# EasyEDA Pro project MovingTarget_MotorConT1_2026-10-31.epro

# Schematic Schematic1
Board Name: MotorConT1; Create Date: 2026-02-08; Page Name: P1; Project Name: MovingTarget; Schematic Name: Schematic1; Update Date: 2026-03-16; Company: EasyEDA.com; Page Size: A4; Version: V1.0
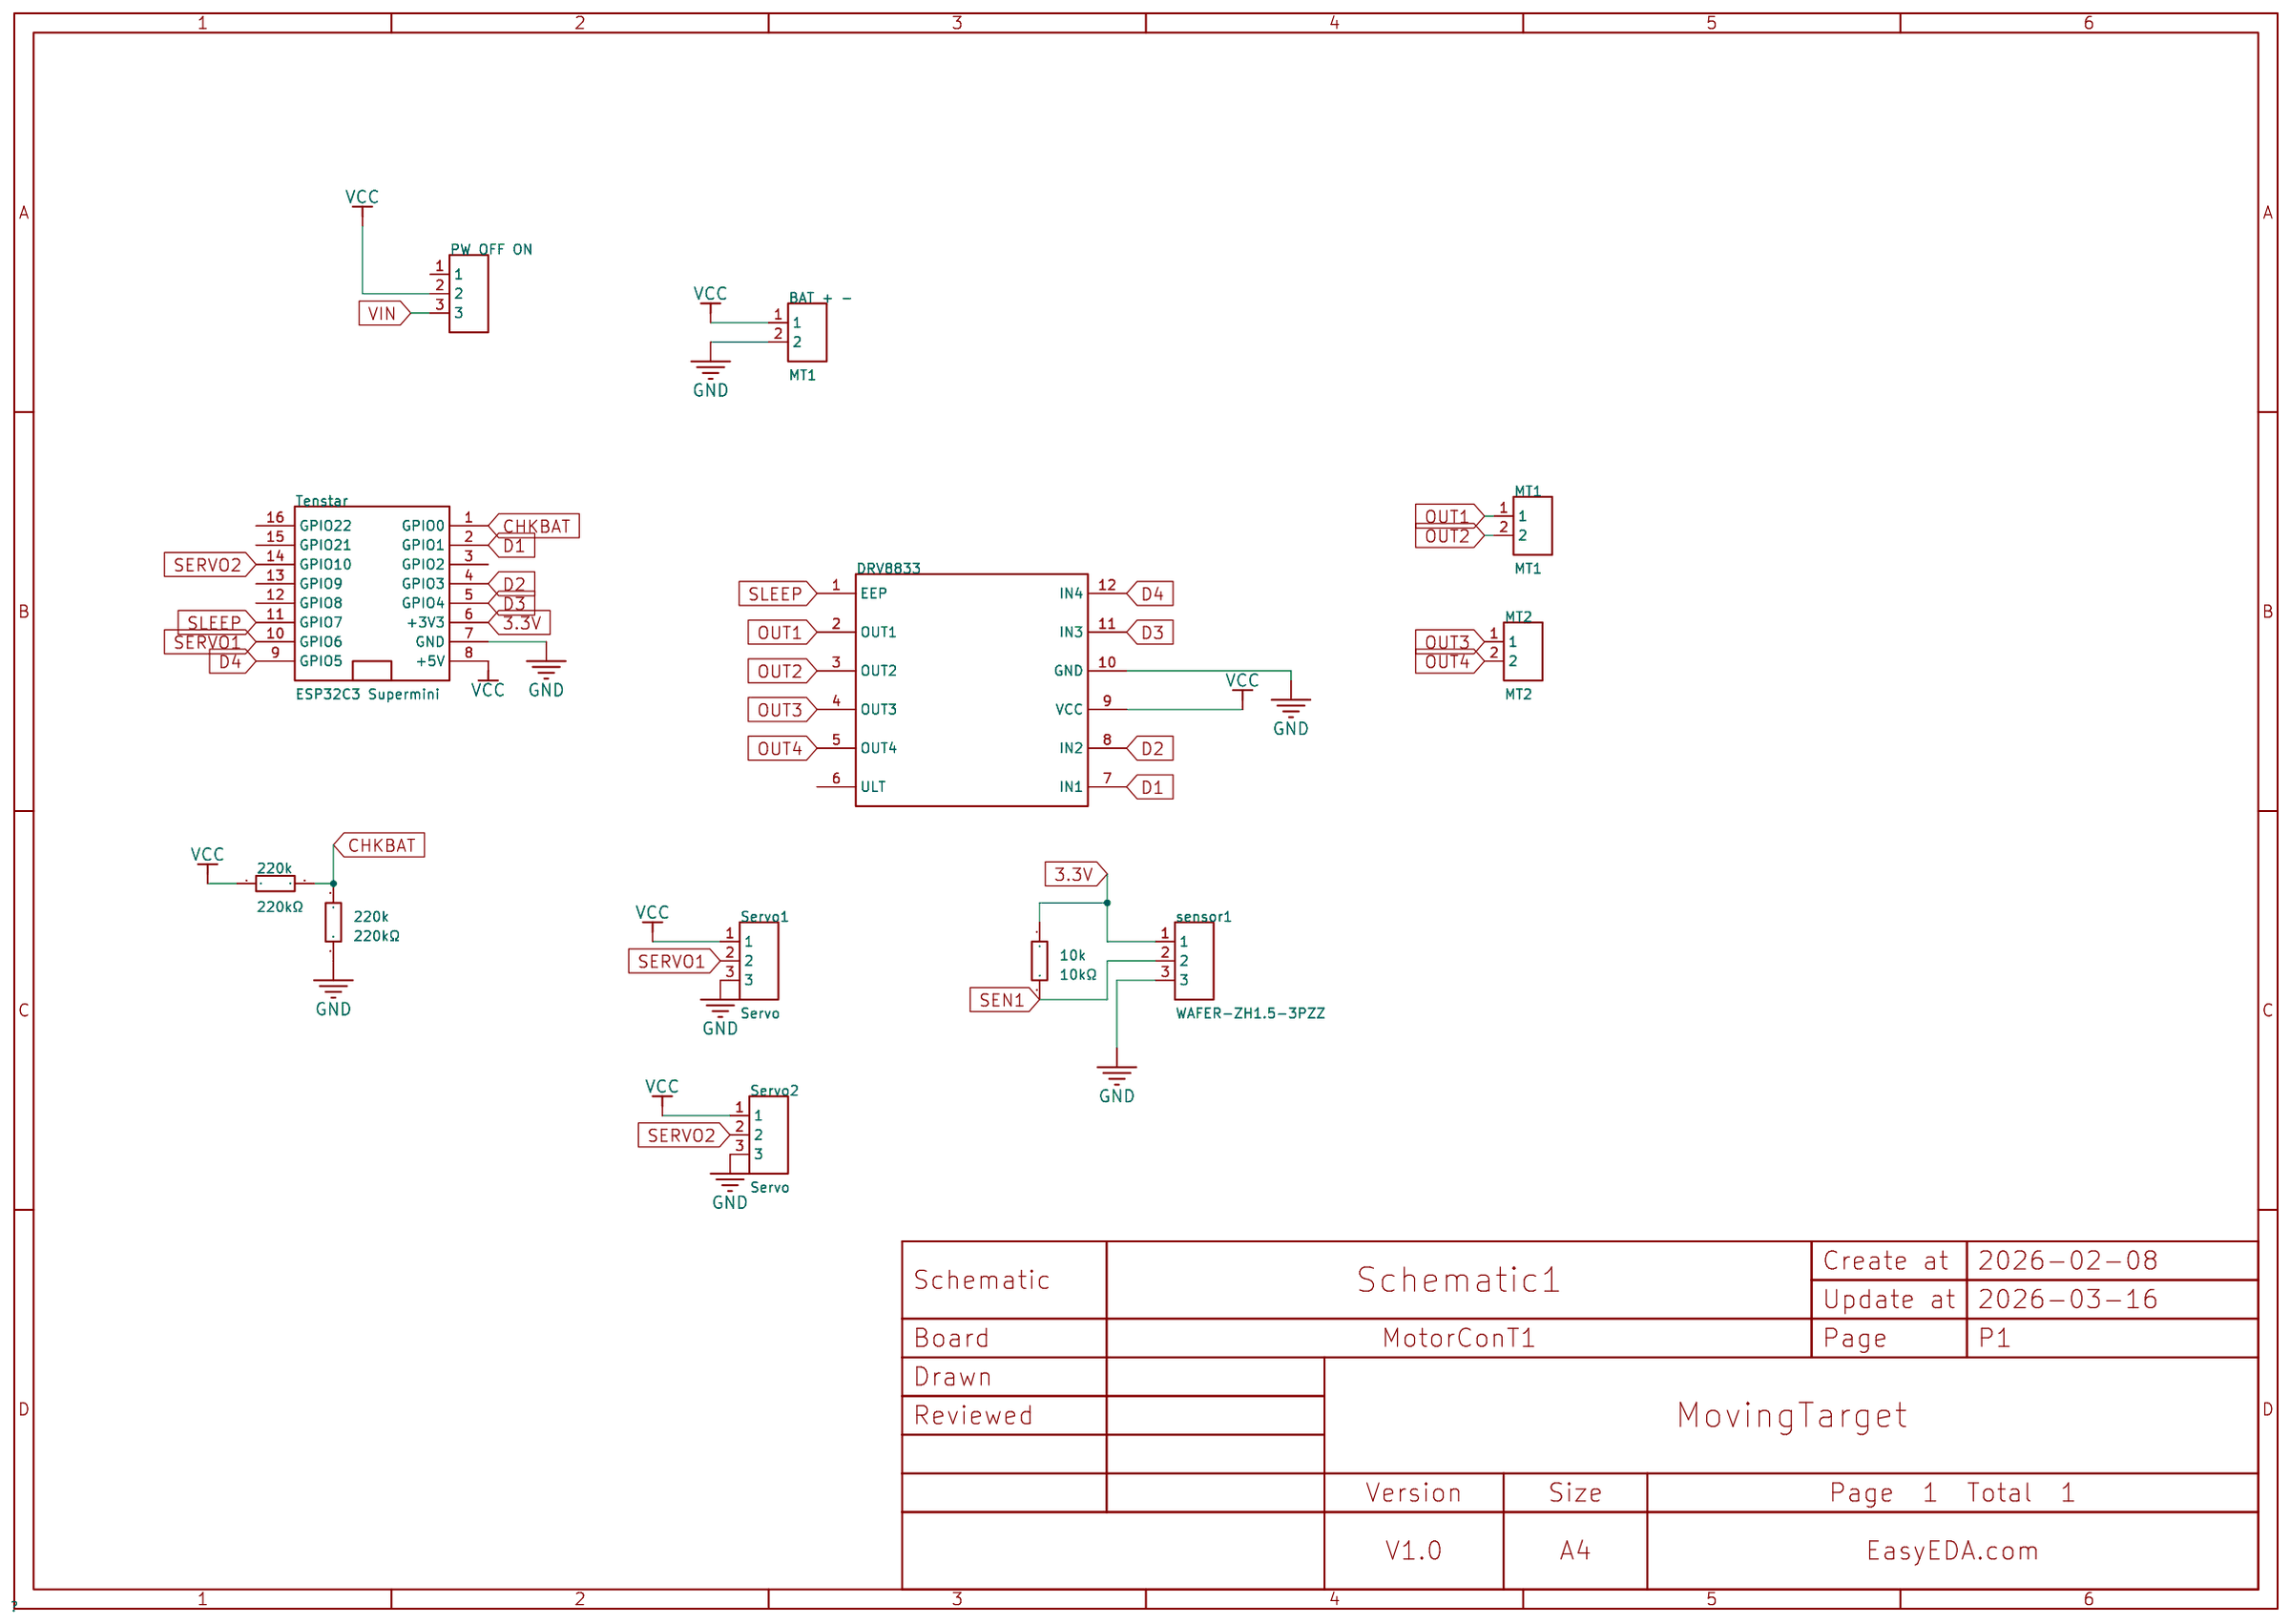
[diagram p0: schematic sheet]

## Parts
10k  10kΩ  [R_AXIAL-0.4]
220k  220kΩ  [R_AXIAL-0.4]
220k#2  220kΩ  [R_AXIAL-0.4]
BAT + -  MT1  [CONN-TH_2P-P1.50_HCTL_HC-ZH1.5-2AW]
DRV8833  -  [DRV8833]
MT1  MT1  [CONN-TH_2P-P1.50_HCTL_HC-ZH1.5-2AW]
MT2  MT2  [CONN-TH_2P-P1.50_HCTL_HC-ZH1.5-2AW]
PW OFF ON  -  [HDR-TH_3P-P2.54-V-M]
sensor1  WAFER-ZH1.5-3PZZ  [CONN-TH_3P-P1.50_A1500WV-03P]
Servo1  Servo  [HDR-TH_3P-P2.54-V-M]
Servo2  Servo  [HDR-TH_3P-P2.54-V-M]
Tenstar  ESP32C3 Supermini  [ESP32C3 SM]

## Library data of the parts
10k 220k 220k#2 = Res_AXIAL-1/4W: Supplier Footprint: Through
BAT + - MT1 MT2 = BX-ZH1.5-2PWZ: 插针结构:1x2P;间距:1.5mm;安装方式:弯插;参考系列:ZH;总PIN数:2P;排数:1;每排PIN数:2;行距:-;额定电流:-;触头材质:黄铜;触头镀层:锡;工作温度:-25℃~+85℃;; LCSC Part Name: 1x2P 间距:1.5mm 弯插 系列:ZH; Supplier Part: C18077736; Manufacturer: Bossie(博锡); Supplier Footprint: 弯插,P=1.5mm; JLCPCB Part Class: 扩展库; Datasheet: https://atta.szlcsc.com/upload/public/pdf/source/20231017/D4B8CDB16C0CF009D30ACC8356399B5A.pdf; Supplier: LCSC; Pins Structure: 1x2P; Pitch: 1.5mm; Mounting Type: 弯插; Reference Series: ZH; Number of Pins: 2P; Number of Rows: 1; Number of PINs Per Row: 2; Contact Material: 黄铜; Contact Plating: 锡; Operating Temperature: -25℃~+85℃; Voltage Rating: 250V; Plastic Material: PA66; Flame Retardant Rating: UL94V-0; Color: 白色; Z-Height of the Board: 3.7mm; X-Length of Bottom Edge on Board (Spacing Line): 4.5mm; Y-Width of Bottom Edge on Board: 4.55mm
DRV8833 = DRV8833: _: 3
PW OFF ON Servo1 Servo2 = HDR-M_2.54_1x3P: Supplier Footprint: Through
sensor1 = WAFER-ZH1.5-3PZZ: Pins Structure:1x3P Pitch:1.5mm Mounting Type:Through Hole Reference Series:ZH Number of Pins:3P Number of Rows:1 Number of PINs Per Row:3 Row Spacing:- Current Rating:2A Contact Material:Brass Contact Plating:Tin Operating Temperature:-25℃~+85℃ Operating; LCSC Part Name: 1x3P 间距:1.5mm 直插 系列:ZH; Supplier Part: C5359584; Manufacturer: XUNPU(讯普); Supplier Footprint: 插件,P=1.5mm; JLCPCB Part Class: Extended Part; Datasheet: https://item.szlcsc.com/datasheet/WAFER-ZH1.5-3PZZ/6173820.html; Supplier: LCSC; Pins Structure: 1x3P; Pitch: 1.5mm; Mounting Type: Through Hole; Reference Series: ZH; Number of Pins: 3P; Number of Rows: 1; Number of PINs Per Row: 3; Current Rating: 2A; Contact Material: Brass; Contact Plating: Tin; Operating Temperature: -25℃~+85℃; Voltage Rating: 250V; Plastic Material: PA66; Flame Retardant Rating: UL94V-0; Color: Beige; Z-Height of the Board: 4.55mm; X-Length of Bottom Edge on Board (Spacing Line): 6mm; Y-Width of Bottom Edge on Board: 3.7mm
Tenstar = ESP32C3 Supermini

## Nets
3.3V: 10k.1 sensor1.1 Tenstar.6(+3V3)
GND: 220k#2.1 BAT + -.2 DRV8833.10(GND) sensor1.3 Servo1.3 Servo2.3 Tenstar.7(GND)
VCC: 220k.1 BAT + -.1 DRV8833.9(VCC) PW OFF ON.2 Servo1.1 Servo2.1 Tenstar.8(+5V)
VIN: PW OFF ON.3
CHKBAT: 220k.2 220k#2.2 Tenstar.1(GPIO0)
D1: DRV8833.7(IN1) Tenstar.2(GPIO1)
D2: DRV8833.8(IN2) Tenstar.4(GPIO3)
D3: DRV8833.11(IN3) Tenstar.5(GPIO4)
D4: DRV8833.12(IN4) Tenstar.9(GPIO5)
OUT1: DRV8833.2(OUT1) MT1.1
OUT2: DRV8833.3(OUT2) MT1.2
OUT3: DRV8833.4(OUT3) MT2.1
OUT4: DRV8833.5(OUT4) MT2.2
SEN1: 10k.2 sensor1.2
SERVO1: Servo1.2 Tenstar.10(GPIO6)
SERVO2: Servo2.2 Tenstar.14(GPIO10)
SLEEP: DRV8833.1(EEP) Tenstar.11(GPIO7)

Not connected (* = marked no-connect by the designer): DRV8833 6(ULT); PW OFF ON 1; Tenstar 3(GPIO2) 12(GPIO8) 13(GPIO9) 15(GPIO21) 16(GPIO22)

# Board PCB1
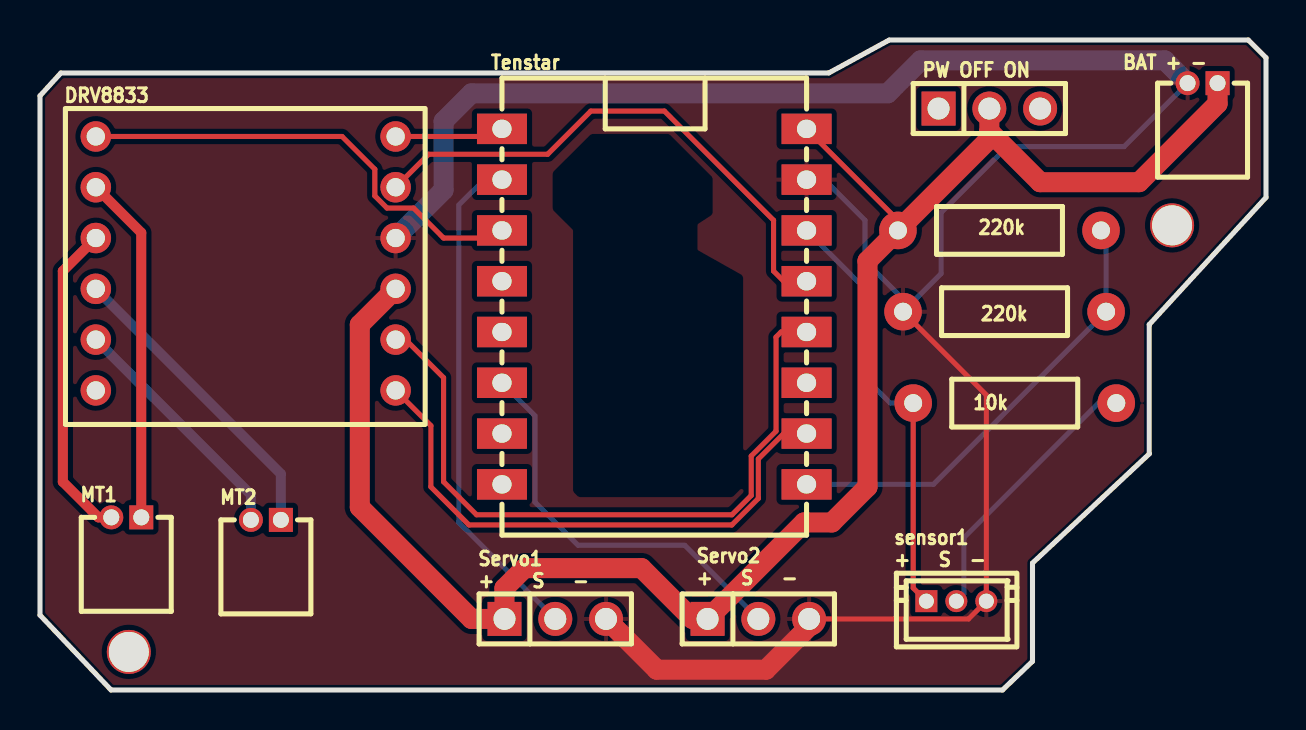
[diagram p1: board, top side]
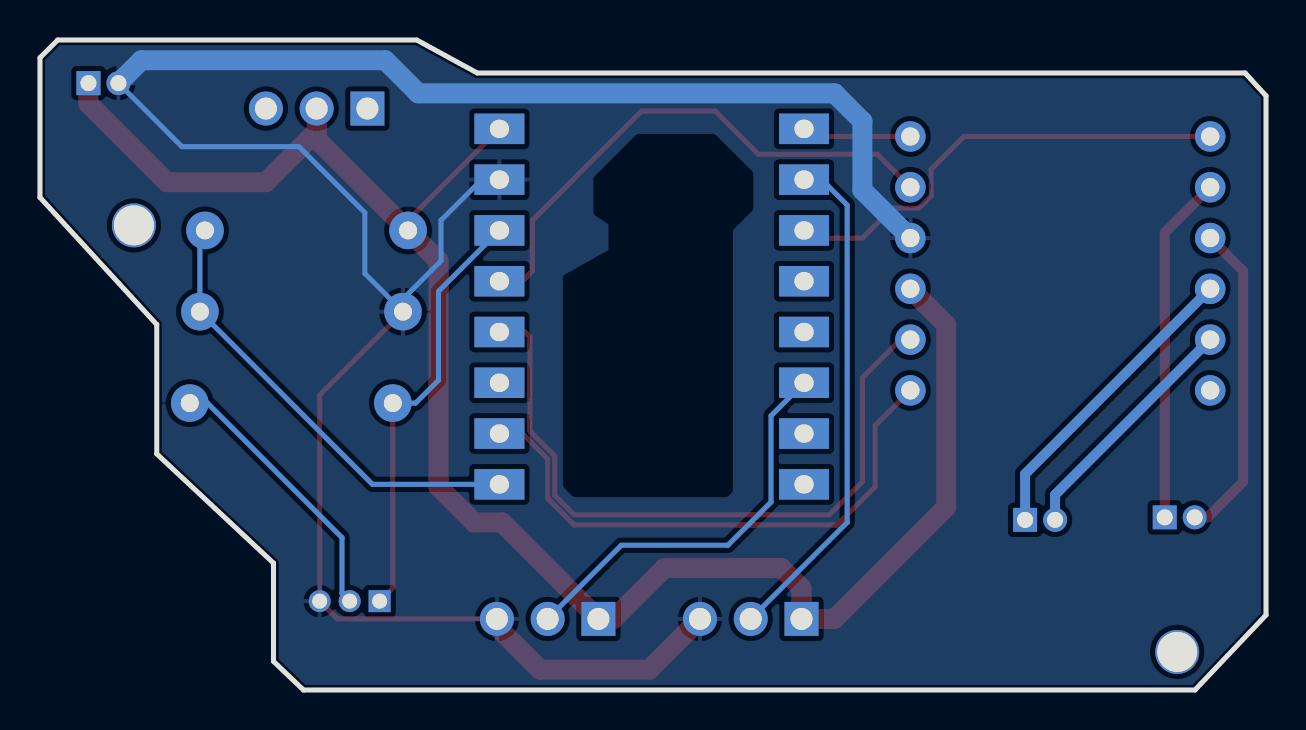
[diagram p2: board, bottom side, seen from below]

Outline 61.34 x 32.51 mm; copper layers: Top Layer, Bottom Layer. Coordinates in mm from the lower left corner of the outline.
Outline path: 0,29.72 1.05,30.86 39.46,30.86 42.49,32.51 60.45,32.51 61.34,31.62 61.34,24.64 55.5,18.28 55.5,11.81 49.66,6.35 49.66,1.43 48.16,0 3.56,0 0,3.75 0,29.72
Stack: Top Layer 0.035mm / Dielectric1 1.51mm FR4 er 4.5 / Bottom Layer 0.035mm

## Design rules (mm)
spacing copperThickness1oz (default): track to track 0.102, other pairs 0.152 to 0.3
spacing copperThickness2oz: track to track 0.203, other pairs 0.152 to 0.3
spacing Plane_innerPlane: track to track 0.102, other pairs 0.152 to 0.3
spacing Copper_copperRegion: track to track 0.102, other pairs 0.152 to 0.3
track width copperThickness1oz (default): min 0.127, default 0.254, max 2.54
track width copperThickness2oz: min 0.203, default 0.254, max 2.54
differential pair differentialPair (default): width min 0.127, default 0.254, max 2.54; gap min 0.152, default 0.152
net CHKBAT uses Copper_copperRegion, Plane_innerPlane
net D1 uses Copper_copperRegion, Plane_innerPlane
net D2 uses Copper_copperRegion, Plane_innerPlane
net D3 uses Copper_copperRegion, Plane_innerPlane
net 3.3V uses Copper_copperRegion, Plane_innerPlane
net GND uses Copper_copperRegion, Plane_innerPlane
net VCC uses Copper_copperRegion, Plane_innerPlane
net D4 uses Copper_copperRegion, Plane_innerPlane
net SERVO1 uses Copper_copperRegion, Plane_innerPlane
net SLEEP uses Copper_copperRegion, Plane_innerPlane
net SERVO2 uses Copper_copperRegion, Plane_innerPlane
net OUT1 uses Copper_copperRegion, Plane_innerPlane
net OUT2 uses Copper_copperRegion, Plane_innerPlane
net OUT3 uses Copper_copperRegion, Plane_innerPlane
net OUT4 uses Copper_copperRegion, Plane_innerPlane
net VIN uses Copper_copperRegion, Plane_innerPlane
net SEN1 uses Copper_copperRegion, Plane_innerPlane
pour e121 uses Copper_copperRegion
pour e148 uses Copper_copperRegion

## Placement (name value [footprint] x y rotation side)
10k  10kΩ  [R_AXIAL-0.4]  48.77 14.35 0 top
220k  220kΩ  [R_AXIAL-0.4]  48.01 22.99 0 top
220k#2  220kΩ  [R_AXIAL-0.4]  48.26 18.92 0 top
BAT + -  MT1  [CONN-TH_2P-P1.50_HCTL_HC-ZH1.5-2AW]  58.17 30.35 0 top
DRV8833  -  [DRV8833]  1.27 29.21 0 top
MT1  MT1  [CONN-TH_2P-P1.50_HCTL_HC-ZH1.5-2AW]  4.32 8.64 0 top
MT2  MT2  [CONN-TH_2P-P1.50_HCTL_HC-ZH1.5-2AW]  11.3 8.51 0 top
NOREF  -  [Pad_e1]  56.64 23.24 0 top
NOREF#2  -  [Pad_e2]  4.45 1.91 0 top
PW OFF ON  -  [HDR-TH_3P-P2.54-V-M]  47.5 29.08 0 top
sensor1
+   S  -  -  [CONN-TH_3P-P1.50_A1500WV-03P]  45.85 4.44 0 top
Servo1
+    S   -  -  [HDR-TH_3P-P2.54-V-M]  25.78 3.56 0 top
Servo2
+   S   -  -  [HDR-TH_3P-P2.54-V-M]  35.94 3.56 0 top
Tenstar  ESP32C3 Supermini  [ESP32C3 SM]  30.73 19.18 0 top

## Footprints (pads in the part's own frame, mm; a bottom-side part is the same pattern mirrored in y, then rotated)
CONN-TH_2P-P1.50_HCTL_HC-ZH1.5-2AW
  rect 1.2x1.2 hole 0.8: 1(0.75,0)
  round 1.2 hole 0.8: 2(-0.75,0)
CONN-TH_3P-P1.50_A1500WV-03P
  rect 1.1x1.1 hole 0.75: 1(-1.5,0)
  round 1.1 hole 0.75: 2(0,0) 3(1.5,0)
DRV8833
  round 1.524 hole 0.914: 1(1.524,-1.524) 2(1.524,-4.064) 3(1.524,-6.604) 4(1.524,-9.144) 5(1.524,-11.684) 6(1.524,-14.224) 7(16.524,-14.224) 8(16.524,-11.684) 9(16.524,-9.144) 10(16.524,-6.604) 11(16.524,-4.064) 12(16.524,-1.524)
ESP32C3 SM
  rect 2.5x1.524 hole 0.96x0.914: 1(7.62,-8.89) 2(7.62,-6.35) 3(7.62,-3.81) 4(7.62,-1.27) 5(7.62,1.27) 6(7.62,3.81) 7(7.62,6.35) 8(7.62,8.89) 9(-7.62,8.89) 10(-7.62,6.35) 11(-7.62,3.81) 12(-7.62,1.27) 13(-7.62,-1.27) 14(-7.62,-3.81) 15(-7.62,-6.35) 16(-7.62,-8.89)
HDR-TH_3P-P2.54-V-M
  rect 1.7x1.7 hole 1.1: 1(-2.54,0)
  round 1.7 hole 1.1: 2(0,0) 3(2.54,0)
Pad_e1
  round 2.2 hole 2: 1(0,0)
Pad_e2
  round 2.2 hole 2: 1(0,0)
R_AXIAL-0.4
  round 1.879 hole 0.899: 1(-5.08,0) 2(5.08,0)

## Nets
3.3V: 10k.1 sensor1
+   S  -.1 Tenstar.6
GND: 220k#2.1 BAT + -.2 DRV8833.10 sensor1
+   S  -.3 Servo1
+    S   -.3 Servo2
+   S   -.3 Tenstar.7
VCC: 220k.1 BAT + -.1 DRV8833.9 PW OFF ON.2 Servo1
+    S   -.1 Servo2
+   S   -.1 Tenstar.8
VIN: PW OFF ON.3
CHKBAT: 220k.2 220k#2.2 Tenstar.1
D1: DRV8833.7 Tenstar.2
D2: DRV8833.8 Tenstar.4
D3: DRV8833.11 Tenstar.5
D4: DRV8833.12 Tenstar.9
OUT1: DRV8833.2 MT1.1
OUT2: DRV8833.3 MT1.2
OUT3: DRV8833.4 MT2.1
OUT4: DRV8833.5 MT2.2
SEN1: 10k.2 sensor1
+   S  -.2
SERVO1: Servo1
+    S   -.2 Tenstar.10
SERVO2: Servo2
+   S   -.2 Tenstar.14
SLEEP: DRV8833.1 Tenstar.11

Pads without a net: DRV8833 6; NOREF 1; NOREF#2 1; PW OFF ON 1; Tenstar 3 12 13 15 16

## Routing (per net, layer and track width the routed paths; a pad name or vN(x,y) marks a point on that pad's centre or on a via; arc(x,y) is an arc through that point)
3.3V: length 21.7
  Top Layer w0.254: sensor1
+   S  -.1 43.69,5.1 10k.1
  Bottom Layer w0.254: Tenstar.6 41.4,19.94 41.4,15.49 42.55,14.35 10k.1
GND: length 113.6
  Top Layer w0.254: 220k#2.1 47.35,14.76 sensor1
+   S  -.3 46.46,3.56 Servo2
+   S   -.3
  Top Layer w1: Servo2
+   S   -.3 38.48,3.17 36.32,1.02 30.86,1.02 Servo1
+    S   -.3
  Bottom Layer w0.254: Tenstar.7 39.24,25.53 41.28,23.5 41.28,21.46 43.18,19.56 220k#2.1 45.08,20.83 45.08,23.88 48.39,27.18 54.24,27.18 BAT + -.2
  Bottom Layer w1: 17.79,22.61 20.19,25 20.19,28.45 21.59,29.84 42.42,29.84 44.07,31.5 56.27,31.5 BAT + -.2
VCC: length 88.7
  Top Layer w0.254: 220k.1 42.93,23.5 Tenstar.8
  Top Layer w1: PW OFF ON.2 47.5,27.94 ; 47.5,27.94 47.5,27.56 220k.1 41.4,21.46 41.4,10.16 39.62,8.38 38.23,8.38 Servo2
+   S   -.1 32.64,3.56 30.1,6.1 24.24,6.1 23.24,5.1 Servo1
+    S   -.1 21.59,3.56 16,9.14 16,18.27 17.79,20.07 ; 47.5,27.94 50.04,25.4 54.99,25.4 58.92,29.33 BAT + -.1
CHKBAT: length 22.7
  Bottom Layer w0.254: 53.09,22.99 53.34,22.73 220k#2.2 44.7,10.29 Tenstar.1
D1: length 28.2
  Top Layer w0.254: Tenstar.2 37.21,12.83 35.94,11.56 35.94,9.58 34.61,8.25 21.46,8.25 19.56,10.16 19.56,13.22 17.79,14.99
D2: length 34.9
  Top Layer w0.254: Tenstar.4 37.08,17.91 36.83,17.65 36.83,12.94 35.58,11.7 35.58,9.73 34.62,8.76 21.84,8.76 20.19,10.41 20.19,15.62 18.29,17.53 17.79,17.53
D3: length 27.2
  Top Layer w0.254: 17.79,25.15 19.45,26.8 25.4,26.8 27.56,28.96 31.24,28.96 36.7,23.5 36.7,20.95 37.21,20.45 Tenstar.5
D4: length 5.5
  Top Layer w0.254: 17.79,27.69 22.73,27.69 Tenstar.9
OUT1: length 17.5
  Top Layer w0.5: MT1.1 5.07,22.87 2.79,25.15
OUT2: length 16
  Top Layer w0.5: DRV8833.3 1.14,20.95 1.14,10.41 2.92,8.64 MT1.2
OUT3: length 15.4
  Bottom Layer w0.5: MT2.1 12.05,10.81 2.79,20.07
OUT4: length 12.2
  Bottom Layer w0.5: DRV8833.5 10.55,9.77 MT2.2
SEN1: length 13.7
  Bottom Layer w0.254: 10k.2 52.96,14.35 46.23,7.62 46.23,4.83 sensor1
+   S  -.2
SERVO1: length 25.4
  Bottom Layer w0.254: Tenstar.10 22.23,25.53 20.95,24.26 20.95,8.38 Servo1
+    S   -.2
SERVO2: length 20.2
  Bottom Layer w0.254: Tenstar.14 24.77,13.72 24.77,9.4 26.92,7.24 32.26,7.24 Servo2
+   S   -.2
SLEEP: length 23.4
  Top Layer w0.254: Tenstar.11 22.73,22.61 20.19,22.61 18.69,24.11 17.36,24.11 16.75,24.72 16.75,26.05 15.11,27.69 2.79,27.69

## Copper pours and planes (outline as drawn; the poured copper is in the pictures)
GND on Top Layer: -1.78,35.18 63.75,35.18 63.75,-2.54 -1.78,-2.54
GND on Bottom Layer: -0.89,32.89 62.86,32.89 62.86,-1.4 -0.89,-1.4
